# EasyEDA Pro project reference-carrier.epro, schematic ESP32S3开发板
Create Date: 2023-04-19; Page Name: P1; Project Name: [单片机] ESP32-S3-WROOM-1 开发板; Schematic Name: ESP32S3开发板; Update Date: 2023-05-01; Company: 嘉立创EDA; Page Size: A4; Version: V1.0
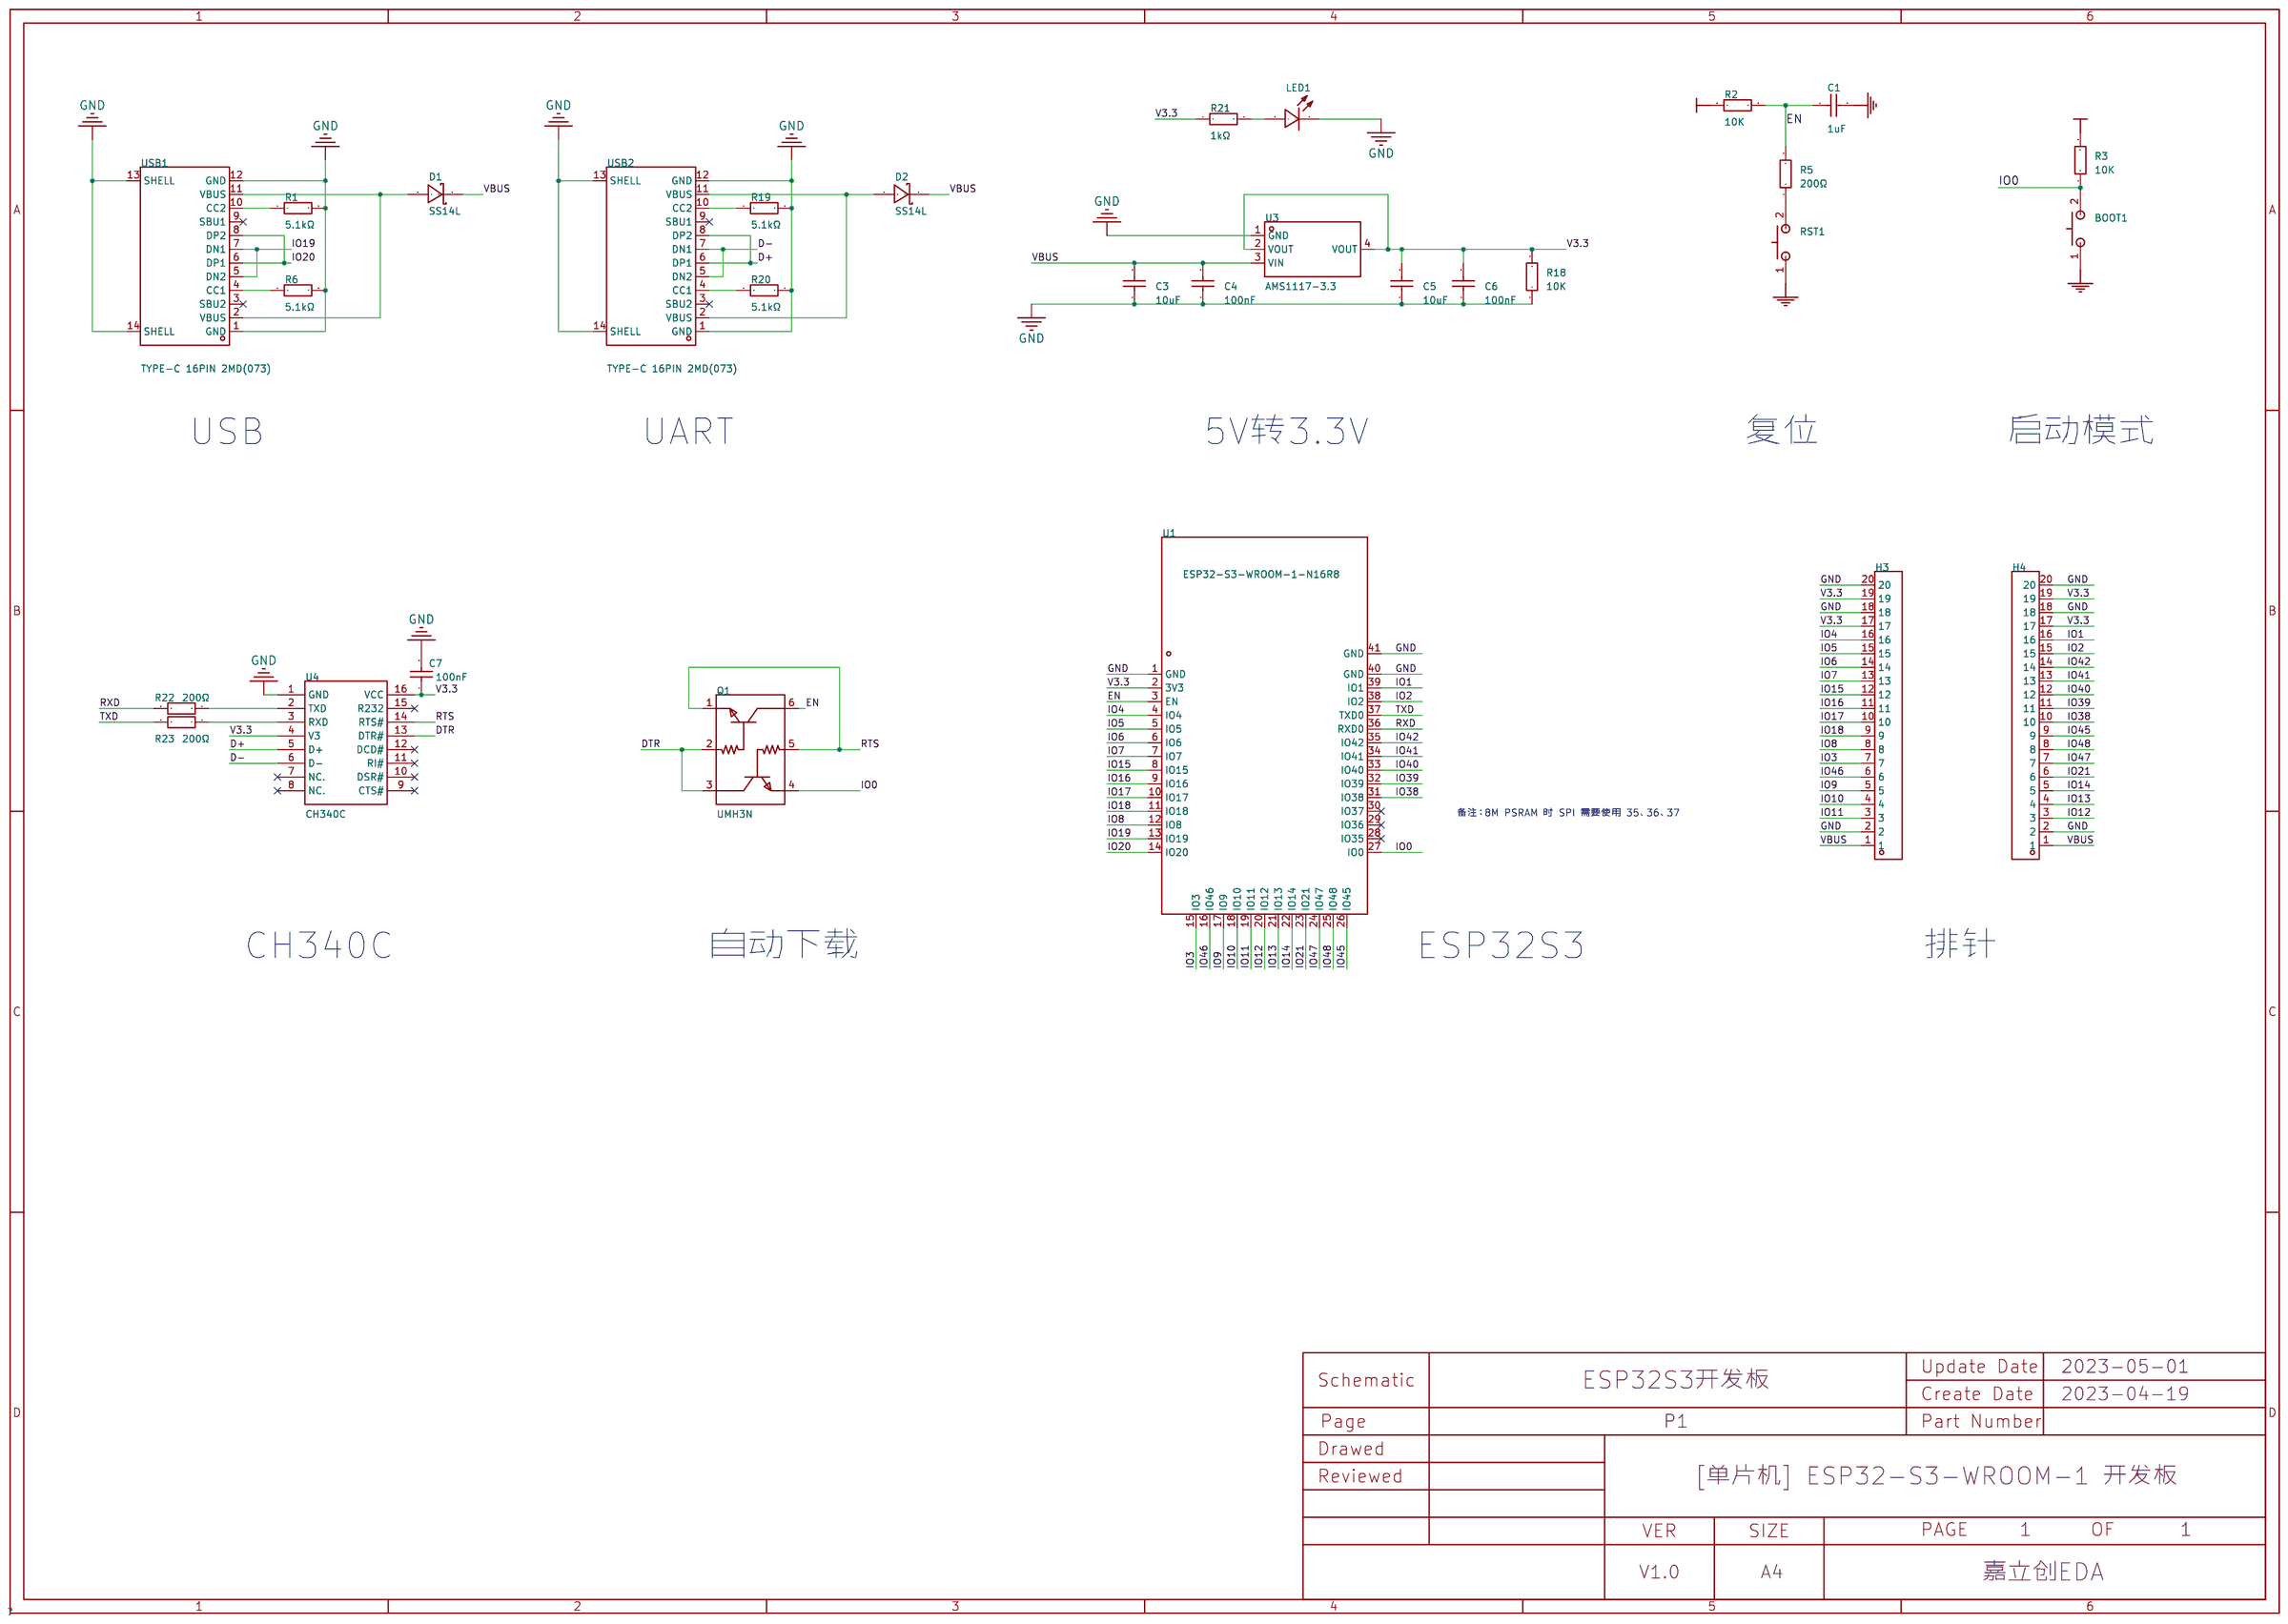
[diagram p0: schematic sheet]

## Parts
BOOT1  GT-TC029B-H025-L1N  [SW-SMD_L3.9-W3.0-P4.45]
C1  1uF  [C0805]
C3  10uF  [C0805]
C4  100nF  [C0805]
C5  10uF  [C0805]
C6  100nF  [C0805]
C7  100nF  [C0805]
D1  SS14L  [SOD-123F_L2.8-W1.8-LS3.7-RD]
D2  SS14L  [SOD-123F_L2.8-W1.8-LS3.7-RD]
H3  KH-2.54PH180-1X20P-L11.5  [HDR-TH_20P-P2.54-V-M]
H4  KH-2.54PH180-1X20P-L11.5  [HDR-TH_20P-P2.54-V-M]
LED1  NCD0805R1  [LED0805-RD_RED]
Q1  UMH3N  [SC-70-6_L2.2-W1.3-P0.65-LS2.1-BR]
R1  5.1kΩ  [R0805]
R2  10K  [R0805]
R3  10K  [R0805]
R5  200Ω  [R0805]
R6  5.1kΩ  [R0805]
R18  10K  [R0805]
R19  5.1kΩ  [R0805]
R20  5.1kΩ  [R0805]
R21  1kΩ  [R0805]
R22  200Ω  [R0805]
R23  200Ω  [R0805]
RST1  GT-TC029B-H025-L1N  [SW-SMD_L3.9-W3.0-P4.45]
U1  ESP32-S3-WROOM-1-N16R8  [WIRELM-SMD_ESP32-S3-WROOM-1]
U3  AMS1117-3.3  [SOT-223-3_L6.5-W3.4-P2.30-LS7.0-BR]
U4  CH340C  [SOP-16_L10.0-W3.9-P1.27-LS6.0-BL]
USB1  TYPE-C 16PIN 2MD(073)  [USB-C-SMD_TYPE-C-6PIN-2MD-073]
USB2  TYPE-C 16PIN 2MD(073)  [USB-C-SMD_TYPE-C-6PIN-2MD-073]

## Library data of the parts
BOOT1 RST1 = GT-TC029B-H025-L1N: 触点电流:50mA;额定电压(DC):12V;绝缘电阻:100MΩ;电路结构:单刀单掷;安装方式:立贴;带灯:无;作用力:250gf@±30gf;机械寿命:10万次;带支架:否;; LCSC Part Name: 3.9*2.9*2.5mm 立贴 轻触开关; Supplier Part: C843669; Manufacturer: G-Switch(品赞); Supplier Footprint: SMD; JLCPCB Part Class: Extended Part; Datasheet: https://atta.szlcsc.com/upload/public/pdf/source/20201014/C843665_B07D254A2E90B746498E934B945CCD5F.pdf; Supplier: LCSC; Contact Current: 50mA; Voltage Rating (DC): 12V; Insulation Resistance: 100MΩ; Circuit: 单刀单掷; Mounting Style: 立贴; Actuator Style: 圆形按钮; Actuator/Cap Color: 黑色; With Lamp: 无; Operating Force: 250gf@±30gf; Mechanical Life: 10万次; Operating Temperature: -30℃~+85℃; Pin Style: SMD接片; Switch Length: 3.9mm; Switch Width: 2.9mm; Switch Height: 2.5mm; Strike Gundam: 否
C1 = CL21F105ZOFNNNE: 温度系数:Y5V;精度:-20%~+80%;容值:1uF;额定电压:16V;; LCSC Part Name: 1uF(105) +80,-20% 16V; Supplier Part: C16834; Manufacturer: SAMSUNG(三星); Supplier Footprint: 0805; JLCPCB Part Class: Extended Part; Datasheet: https://atta.szlcsc.com/upload/public/pdf/source/20160103/1457707690495.pdf; Supplier: LCSC; Temperature Coefficient: Y5V; Tolerance: -20%~+80%; Voltage Rated: 16V
C3 C5 = CL21A106KAYNNNE_C15850: 容值:10uF;精度:±10%;额定电压:25V;材质(温度系数):X5R;; LCSC Part Name: 10uF ±10% 25V; Supplier Part: C15850; Manufacturer: SAMSUNG(三星); Manufacturer Part: CL21A106KAYNNNE; Supplier Footprint: 0805; JLCPCB Part Class: Basic Part; Datasheet: https://atta.szlcsc.com/upload/public/pdf/source/20160103/1457707679302.pdf; Supplier: LCSC; Tolerance: ±10%; Voltage Rated: 25V; Temperature Coefficient: X5R
C4 C6 C7 = CC0805KRX7R9BB104: 容值:100nF;精度:±10%;额定电压:50V;材质(温度系数):X7R;; LCSC Part Name: 100nF ±10% 50V; Supplier Part: C49678; Manufacturer: YAGEO(国巨); Supplier Footprint: 0805; JLCPCB Part Class: Basic Part; Datasheet: https://atta.szlcsc.com/upload/public/pdf/source/20151026/1457707504898.pdf; Supplier: LCSC; Tolerance: ±10%; Voltage Rated: 50V; Temperature Coefficient: X7R
D1 D2 = SS14L: 直流反向耐压(Vr):40V;平均整流电流(Io):1A;正向压降(Vf):550mV 1A;; Supplier Part: C190475; Manufacturer: Hottech(合科泰); Supplier Footprint: SOD-123F; JLCPCB Part Class: Extended Part; Datasheet: https://atta.szlcsc.com/upload/public/pdf/source/20180420/C190475_B414FF979281B09C05D3FAC1A9A40A2C.pdf; Supplier: LCSC; Reverse Voltage (Vr): 40V; Average Rectified Current (Io): 1A; Forward Voltage (Vf@If): 550mV 1A
H3 H4 = KH-2.54PH180-1X20P-L11.5: 排数:单排;总PIN位数:20;间距:2.54mm;插针结构:1x20P;行距:-;安装类型:直插;圆针/方针:方针;额定电流:3A;额定电压:-;配合针长度:6mm;塑高:2.5mm;端接针长度:3mm;触头材质:-;工作温度范围:-40℃~+105℃;颜色:黑色;; LCSC Part Name: 2.54mm 1x20P 直插 方针; Supplier Part: C2905493; Manufacturer: kinghelm(金航标); Supplier Footprint: 直插,P=2.54mm; JLCPCB Part Class: Extended Part; Datasheet: https://atta.szlcsc.com/upload/public/pdf/source/20211019/FD4A80C1CFFD912DA26274B60C012C16.pdf; Supplier: LCSC; Number of Rows: 单排; Number of Pins: 20; Pitch: 2.54mm; Pin Structure: 1x20P; Mounting Type: 直插; Circluar Pins/Square Pins: 方针; Current Rating (Max): 3A; Length of Mating Pin: 6mm; Insulation Height: 2.5mm; Length of End Connection Pin: 3mm; Operating Temperature Range: -40℃~+105℃; Color: 黑色
LED1 = NCD0805R1: 发光颜色:红灯;; LCSC Part Name: 红灯; Supplier Part: C84256; Manufacturer: 国星光电; Supplier Footprint: 0805; JLCPCB Part Class: Basic Part; Datasheet: https://atta.szlcsc.com/upload/public/pdf/source/20200820/C84256_F0A75A43B3EAD75808600A0514C76B99.pdf; Supplier: LCSC; Emitted Color: 红灯
Q1 = UMH3N: 晶体管类型:2个NPN-预偏置;功率(Pd):150mW;集电极电流(Ic):100mA;集射极击穿电压(Vceo):50V;; LCSC Part Name: 2个NPN-预偏置 100mA 50V; Supplier Part: C62892; Manufacturer: CJ(江苏长电/长晶); Supplier Footprint: SC-70-6(SOT-363); JLCPCB Part Class: Extended Part; Datasheet: https://atta.szlcsc.com/upload/public/pdf/source/20151109/1457707575095.pdf; Supplier: LCSC; Transistor Type: 2个NPN-预偏置; Power Dissipation (Pd): 150mW; Collector Current (Ic): 100mA; Collector-Emitter Breakdown Voltage (Vceo): 50V
R1 R6 R19 R20 = 0805W8F5101T5E: 电阻类型:厚膜电阻;阻值:5.1kΩ;精度:±1%;功率:125mW;温度系数:±100ppm/℃;最大工作电压:150V;工作温度范围:-55℃~+155℃;; LCSC Part Name: 5.1kΩ ±1% 125mW; Supplier Part: C27834; Manufacturer: UNI-ROYAL(厚声); Supplier Footprint: 0805; JLCPCB Part Class: Basic Part; Datasheet: https://atta.szlcsc.com/upload/public/pdf/source/20200306/C422600_1E6D84923E4A46A82E41ADD87F860B5C.pdf; Supplier: LCSC; Type: 厚膜电阻; Tolerance: ±1%; Power(Watts): 125mW; Temperature Coefficient: ±100ppm/℃; Overload Voltage (Max): 150V; Operating Temperature Range: -55℃~+155℃
R2 R3 R18 = 0805W8F510KT5E: LCSC Part Name: 5.1Ω(5R10) ±1% 编带; Supplier Part: C17724; Manufacturer: UNI-ROYAL(厚声); Supplier Footprint: 0805; JLCPCB Part Class: Basic Part; Datasheet: https://atta.szlcsc.com/upload/public/pdf/source/20170920/C17724_1505887215123980079.pdf; Supplier: LCSC
R5 R22 R23 = 0805W8F2000T5E: 电阻类型:厚膜电阻;阻值:200Ω;精度:±1%;功率:125mW;温度系数:±100ppm/℃;最大工作电压:150V;工作温度范围:-55℃~+155℃;; LCSC Part Name: 200Ω ±1% 125mW; Supplier Part: C17540; Manufacturer: UNI-ROYAL(厚声); Supplier Footprint: 0805; JLCPCB Part Class: Basic Part; Datasheet: https://atta.szlcsc.com/upload/public/pdf/source/20200306/C422600_1E6D84923E4A46A82E41ADD87F860B5C.pdf; Supplier: LCSC; Type: 厚膜电阻; Tolerance: ±1%; Power(Watts): 125mW; Temperature Coefficient: ±100ppm/℃; Overload Voltage (Max): 150V; Operating Temperature Range: -55℃~+155℃
R21 = 0805W8F1001T5E: 电阻类型:厚膜电阻;阻值:1kΩ;精度:±1%;功率:125mW;; LCSC Part Name: 1kΩ ±1% 125mW; Supplier Part: C17513; Manufacturer: UNI-ROYAL(厚声); Supplier Footprint: 0805; JLCPCB Part Class: Basic Part; Datasheet: https://atta.szlcsc.com/upload/public/pdf/source/20200306/C422600_1E6D84923E4A46A82E41ADD87F860B5C.pdf; Supplier: LCSC; Type: 厚膜电阻; Tolerance: ±1%; Power(Watts): 125mW; Temperature Coefficient: ±100ppm/℃; Overload Voltage (Max): 150V; Operating Temperature Range: -55℃~+155℃
U1 = ESP32-S3-WROOM-1-N16R8: Supplier Part: C2913202; Manufacturer: ESPRESSIF(乐鑫); Supplier Footprint: SMD,18x25.5mm; JLCPCB Part Class: Extended Part; Datasheet: https://atta.szlcsc.com/upload/public/pdf/source/20220705/4E799F39581577F766659887F738A439.pdf; Supplier: LCSC
U3 = AMS1117-3.3_C6186: 输出类型:固定;输出极性:正;输出通道数:1;最大输入电压:-;输出电压:3.3V;压差:1.3V@(800mA);静态电流(地电流):-;输出电流:1A;电源纹波抑制比(PSRR):72dB@(120Hz);噪声:-;特性:-;工作温度:-;; LCSC Part Name: 正 Vout=3.3V 1A 72dB@(120Hz); Supplier Part: C6186; Manufacturer: AMS; Supplier Footprint: SOT-223-3; JLCPCB Part Class: Basic Part; Datasheet: https://atta.szlcsc.com/upload/public/pdf/source/20180727/C6186_7A095716F0823C02F1997A905E26C086.pdf; Supplier: LCSC; Output Type: 固定; Output Polarity: 正; Number of Outputs: 1; Output Voltage: 3.3V; Dropout Voltage: 1.3V@(800mA); Output Current: 1A; Power Supply Rejection Ratio (PSRR): 72dB@(120Hz)
U4 = CH340C: 应用功能:Transceiver;接口协议:USB 2.0;数据速率:2Mbps;供电电压:3.3V；5V;; Supplier Part: C84681; Manufacturer: WCH(南京沁恒); Supplier Footprint: SOP-16; JLCPCB Part Class: Extended Part; Datasheet: https://atta.szlcsc.com/upload/public/pdf/source/20200819/C84681_ADBED554CE321879DBD6B1D06488689C.pdf; Supplier: LCSC; Applications Function: Transceiver; Protocol: USB 2.0; Data Rate: 2Mbps; Supply Voltage: 3.3V；5V
USB1 USB2 = TYPE-C 16PIN 2MD(073): 连接器类型:Type-C;标准:-;公母:母座;触点数量:16;端口数量:1;安装方式:卧贴;额定电流 - 电源:5A;工作温度范围:-25℃~+85℃;; LCSC Part Name: TYPE-C母座 16P 4脚插件带定位柱 不锈钢外壳 2次模顶; Supplier Part: C2765186; Manufacturer: SHOU HAN(首韩); Supplier Footprint: SMD; JLCPCB Part Class: Extended Part; Datasheet: https://atta.szlcsc.com/upload/public/pdf/source/20211123/39B17C16241EAC15C5E277BDA434118E.pdf; Supplier: LCSC; Connector Type: Type-C; Gender: 母座; Number of Contacts: 16; Number of Ports: 1; Mounting Style: 卧贴; Current Rating - Power (Max): 5A; Operating Temperature Range: -25℃~+85℃

## Nets
GND: BOOT1.1 C1.2 C3.1 C4.1 C5.1 C6.1 C7.2 H3.2 H3.18 H3.20 H4.2 H4.18 H4.20 LED1.1(-) R1.2 R6.2 R18.1 R19.2 R20.2 RST1.1 U1.1(GND) U1.40(GND) U1.41(GND) U3.1(GND) U4.1(GND) USB1.1(GND) USB1.12(GND) USB1.13(SHELL) USB1.14(SHELL) USB2.1(GND) USB2.12(GND) USB2.13(SHELL) USB2.14(SHELL)
V3.3: C5.2 C6.2 C7.1 H3.17 H3.19 H4.17 H4.19 R2.1 R3.2 R18.2 R21.1 U1.2(3V3) U3.2(VOUT) U3.4(VOUT) U4.4(V3) U4.16(VCC)
VBUS: C3.2 C4.2 D1.1(K) D2.1(K) H3.1 H4.1 U3.3(VIN)
D+: U4.5(D+) USB2.6(DP1) USB2.8(DP2)
D-: U4.6(D-) USB2.5(DN2) USB2.7(DN1)
DTR: Q1.2(B) Q1.3(C) U4.13(DTR#)
EN: C1.1 Q1.6(C) R2.2 R5.2 U1.3(EN)
IO0: BOOT1.2 Q1.4(E) R3.1 U1.27(IO0)
IO1: H4.16 U1.39(IO1)
IO2: H4.15 U1.38(IO2)
IO3: H3.7 U1.15(IO3)
IO4: H3.16 U1.4(IO4)
IO5: H3.15 U1.5(IO5)
IO6: H3.14 U1.6(IO6)
IO7: H3.13 U1.7(IO7)
IO8: H3.8 U1.12(IO8)
IO9: H3.5 U1.17(IO9)
IO10: H3.4 U1.18(IO10)
IO11: H3.3 U1.19(IO11)
IO12: H4.3 U1.20(IO12)
IO13: H4.4 U1.21(IO13)
IO14: H4.5 U1.22(IO14)
IO15: H3.12 U1.8(IO15)
IO16: H3.11 U1.9(IO16)
IO17: H3.10 U1.10(IO17)
IO18: H3.9 U1.11(IO18)
IO19: U1.13(IO19) USB1.5(DN2) USB1.7(DN1)
IO20: U1.14(IO20) USB1.6(DP1) USB1.8(DP2)
IO21: H4.6 U1.23(IO21)
IO38: H4.10 U1.31(IO38)
IO39: H4.11 U1.32(IO39)
IO40: H4.12 U1.33(IO40)
IO41: H4.13 U1.34(IO41)
IO42: H4.14 U1.35(IO42)
IO45: H4.9 U1.26(IO45)
IO46: H3.6 U1.16(IO46)
IO47: H4.7 U1.24(IO47)
IO48: H4.8 U1.25(IO48)
RTS: Q1.1(E) Q1.5(B) U4.14(RTS#)
RXD: R22.2 U1.36(RXD0)
TXD: R23.2 U1.37(TXD0)
$1N977: R1.1 USB1.10(CC2)
$1N978: R6.1 USB1.4(CC1)
$1N984: D1.2(A) USB1.2(VBUS) USB1.11(VBUS)
$1N3135: R19.1 USB2.10(CC2)
$1N3136: R20.1 USB2.4(CC1)
$1N3142: D2.2(A) USB2.2(VBUS) USB2.11(VBUS)
$1N8419: LED1.2(+) R21.2
$1N10176: R22.1 U4.2(TXD)
$1N10216: R23.1 U4.3(RXD)
Net-(R5-1): R5.1 RST1.2

Not connected (* = marked no-connect by the designer): U1 28(IO35)* 29(IO36)* 30(IO37)*; U4 7(NC.)* 8(NC.)* 9(CTS#)* 10(DSR#)* 11(RI#)* 12(DCD#)* 15(R232)*; USB1 3(SBU2)* 9(SBU1)*; USB2 3(SBU2)* 9(SBU1)*

## Notes on the sheet
- USB
- UART
- 5V转3.3V
- 复位
- 启动模式
- 备注：8M PSRAM 时 SPI 需要使用 35、36、37
- CH340C
- 自动下载
- ESP32S3
- 排针
